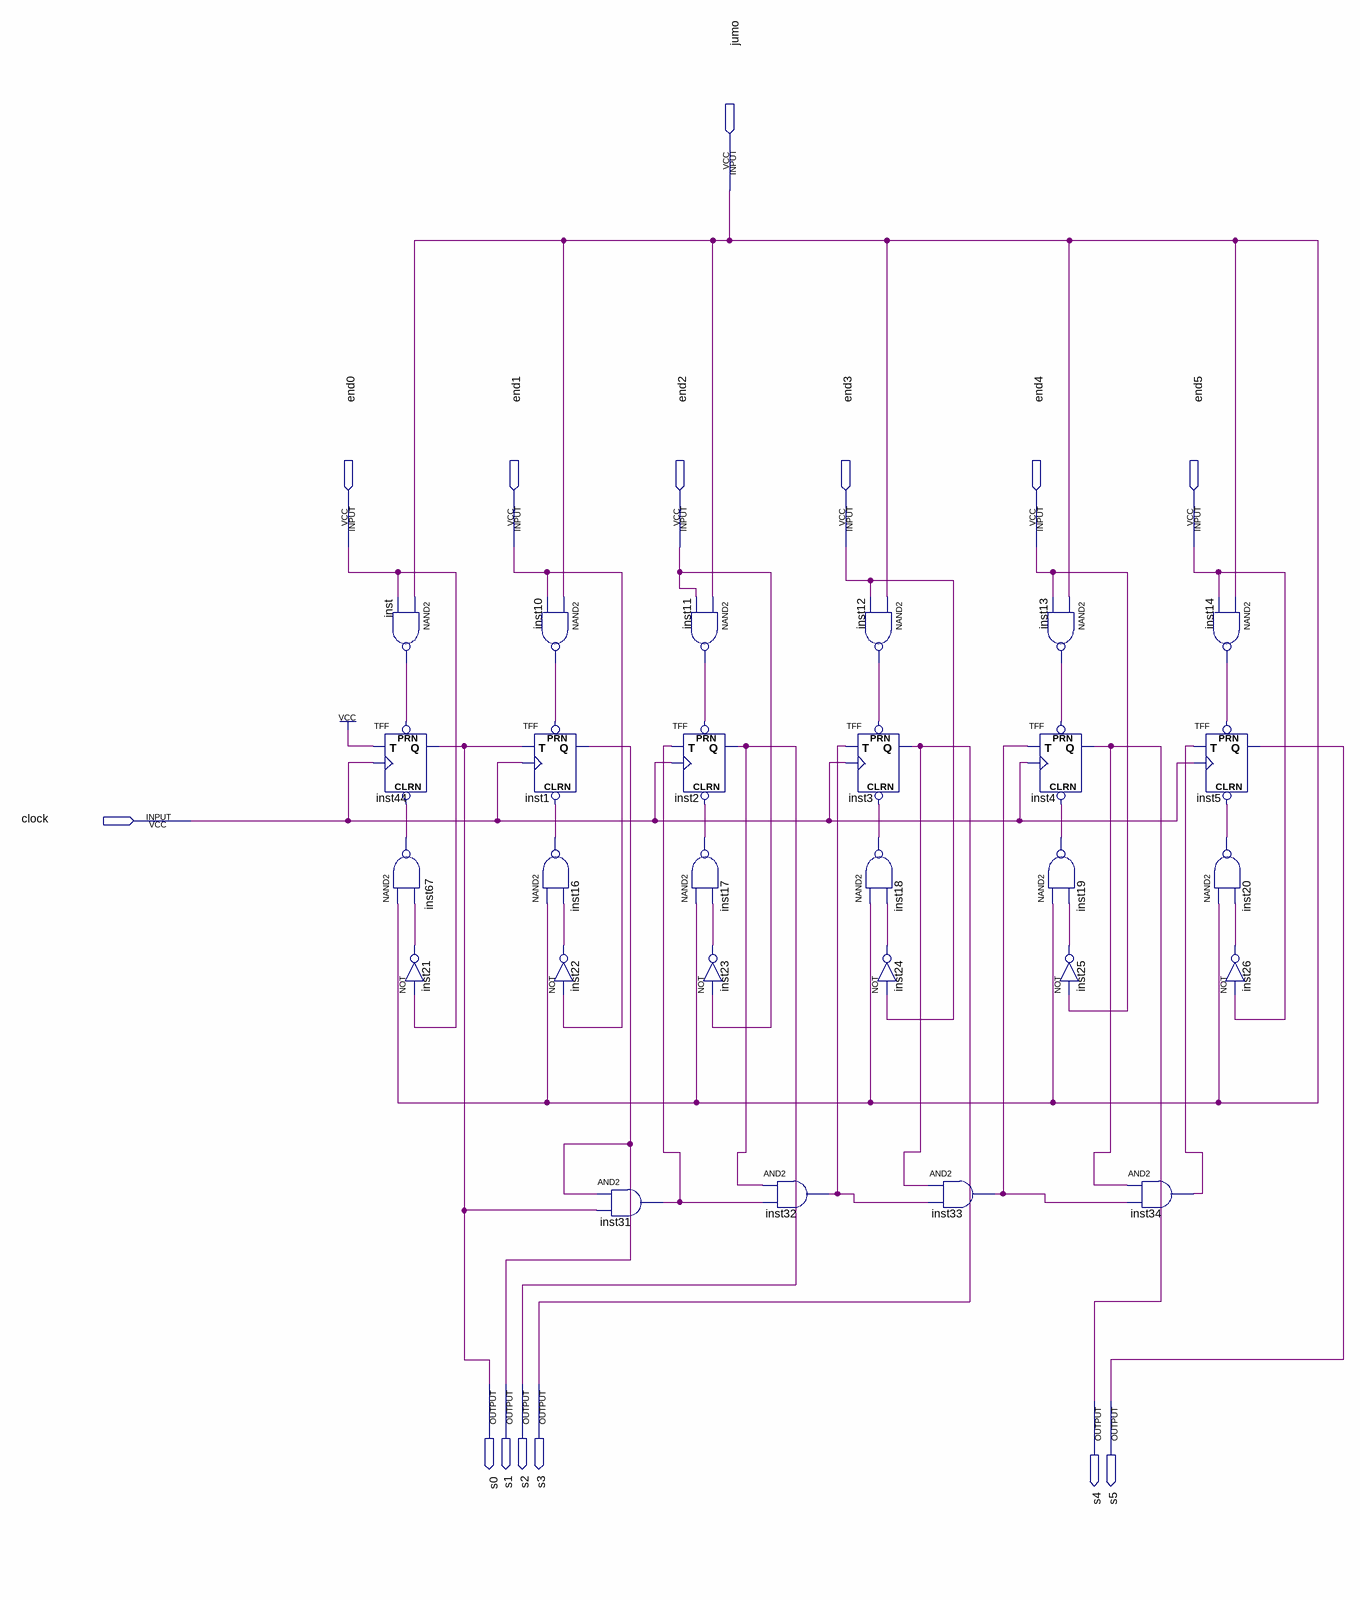
[diagram p0: schematic sheet]
// Quartus schematic contajump.bdf as structural Verilog: 28 symbols, 14 pins
module contajump (
  input  jumo,
  input  end0,
  input  end1,
  input  end2,
  input  end3,
  input  end4,
  input  end5,
  input  clock,
  output s0,
  output s1,
  output s2,
  output s3,
  output s4,
  output s5
);

  wire inst10_out, inst11_out, inst12_out, inst13_out, inst14_out, inst16_out, inst17_out, inst18_out,
       inst19_out, inst20_out, inst21_out, inst22_out, inst23_out, inst24_out, inst25_out, inst26_out,
       inst31_out, inst32_out, inst33_out, inst34_out, inst67_out, inst_out;

  nand inst (inst_out, jumo, end0);
  TFF inst44 (.PRN(inst_out), .CLRN(inst67_out), .T(1'b1), .CLK(clock), .Q(s0));
  nand inst67 (inst67_out, jumo, inst21_out);
  not inst21 (inst21_out, end0);
  TFF inst1 (.PRN(inst10_out), .CLRN(inst16_out), .T(s0), .CLK(clock), .Q(s1));
  nand inst10 (inst10_out, jumo, end1);
  nand inst16 (inst16_out, jumo, inst22_out);
  not inst22 (inst22_out, end1);
  and inst31 (inst31_out, s1, s0);
  nand inst11 (inst11_out, jumo, end2);
  TFF inst2 (.PRN(inst11_out), .CLRN(inst17_out), .T(inst31_out), .CLK(clock), .Q(s2));
  nand inst17 (inst17_out, jumo, inst23_out);
  not inst23 (inst23_out, end2);
  and inst32 (inst32_out, s2, inst31_out);
  nand inst12 (inst12_out, jumo, end3);
  TFF inst3 (.PRN(inst12_out), .CLRN(inst18_out), .T(inst32_out), .CLK(clock), .Q(s3));
  nand inst18 (inst18_out, jumo, inst24_out);
  not inst24 (inst24_out, end3);
  and inst33 (inst33_out, s3, inst32_out);
  nand inst13 (inst13_out, jumo, end4);
  TFF inst4 (.PRN(inst13_out), .CLRN(inst19_out), .T(inst33_out), .CLK(clock), .Q(s4));
  nand inst19 (inst19_out, jumo, inst25_out);
  not inst25 (inst25_out, end4);
  and inst34 (inst34_out, s4, inst33_out);
  nand inst14 (inst14_out, jumo, end5);
  TFF inst5 (.PRN(inst14_out), .CLRN(inst20_out), .T(inst34_out), .CLK(clock), .Q(s5));
  nand inst20 (inst20_out, jumo, inst26_out);
  not inst26 (inst26_out, end5);
endmodule
